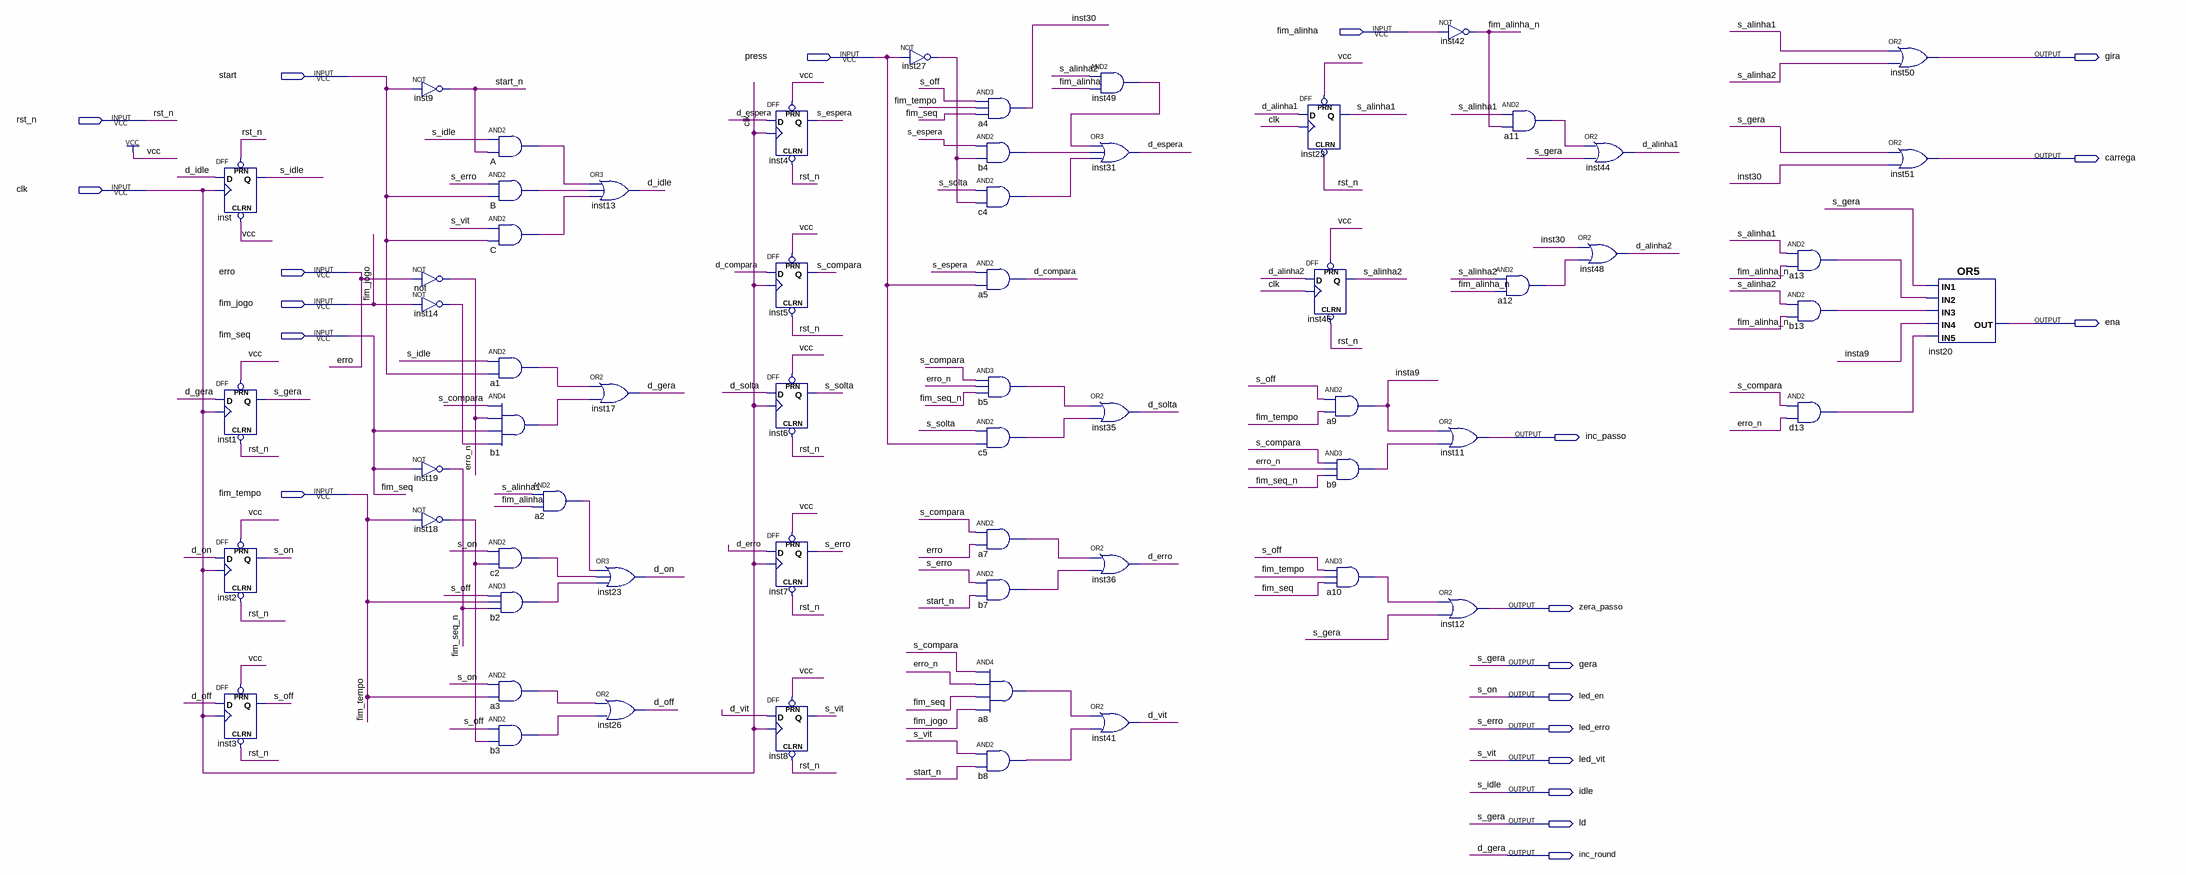
[diagram p0: schematic sheet]
// Quartus schematic fsm.bdf as structural Verilog: 62 symbols, 21 pins
module fsm (
  input  fim_alinha,
  input  press,
  input  start,
  input  rst_n,
  input  clk,
  input  erro,
  input  fim_jogo,
  input  fim_seq,
  input  fim_tempo,
  output gira,
  output carrega,
  output ena,
  output inc_passo,
  output zera_passo,
  output gera,
  output led_en,
  output led_erro,
  output led_vit,
  output idle,
  output ld,
  output inc_round
);

  wire a1_out, a2_out, a3_out, a7_out, a8_out, a10_out, a11_out, a12_out, a13_out, A_out, b1_out, b2_out,
       b3_out, b4_out, b5_out, b7_out, b8_out, b9_out, b13_out, B_out, c2_out, c4_out, c5_out, C_out,
       d13_out, d_alinha1, d_alinha2, d_compara, d_erro, d_espera, d_idle, d_off, d_on, d_solta, d_vit,
       erro_n, fim_alinha_n, fim_seq_n, inst14_out, inst18_out, inst27_out, inst30, inst49_out, insta9,
       s_alinha1, s_alinha2, s_compara, s_espera, s_off, s_solta, start_n;

  DFF inst (.CLRN(1'b1), .CLK(clk), .D(d_idle), .PRN(rst_n), .Q(idle));
  DFF inst1 (.CLRN(rst_n), .CLK(clk), .D(inc_round), .PRN(1'b1), .Q(gera));
  DFF inst2 (.CLRN(rst_n), .CLK(clk), .D(d_on), .PRN(1'b1), .Q(led_en));
  DFF inst3 (.CLRN(rst_n), .CLK(clk), .D(d_off), .PRN(1'b1), .Q(s_off));
  not inst9 (start_n, start);
  not \not  (erro_n, erro);
  not inst14 (inst14_out, fim_jogo);
  not inst19 (fim_seq_n, fim_seq);
  not inst18 (inst18_out, fim_tempo);
  and A (A_out, idle, start_n);
  and B (B_out, led_erro, start);
  and C (C_out, led_vit, start);
  and a1 (a1_out, idle, start);
  and b1 (b1_out, s_compara, erro_n, fim_seq, inst14_out);
  and c2 (c2_out, led_en, inst18_out);
  and b2 (b2_out, s_off, fim_tempo, fim_seq_n);
  and a3 (a3_out, led_en, fim_tempo);
  and b3 (b3_out, s_off, inst18_out);
  and a2 (a2_out, s_alinha1, fim_alinha);
  or inst13 (d_idle, A_out, B_out, C_out);
  or inst17 (inc_round, a1_out, b1_out);
  or inst23 (d_on, a2_out, c2_out, b2_out);
  or inst26 (d_off, a3_out, b3_out);
  DFF inst4 (.CLRN(rst_n), .CLK(clk), .D(d_espera), .PRN(1'b1), .Q(s_espera));
  DFF inst5 (.CLRN(rst_n), .CLK(clk), .D(d_compara), .PRN(1'b1), .Q(s_compara));
  DFF inst6 (.CLRN(rst_n), .CLK(clk), .D(d_solta), .PRN(1'b1), .Q(s_solta));
  DFF inst7 (.CLRN(rst_n), .CLK(clk), .D(d_erro), .PRN(1'b1), .Q(led_erro));
  DFF inst8 (.CLRN(rst_n), .CLK(clk), .D(d_vit), .PRN(1'b1), .Q(led_vit));
  not inst27 (inst27_out, press);
  and a4 (inst30, s_off, fim_tempo, fim_seq);
  and b4 (b4_out, s_espera, inst27_out);
  and c4 (c4_out, s_solta, inst27_out);
  and a5 (d_compara, s_espera, press);
  and b5 (b5_out, s_compara, erro_n, fim_seq_n);
  and c5 (c5_out, s_solta, press);
  and a7 (a7_out, s_compara, erro);
  and b7 (b7_out, led_erro, start_n);
  and a8 (a8_out, s_compara, erro_n, fim_seq, fim_jogo);
  and b8 (b8_out, led_vit, start_n);
  and inst49 (inst49_out, s_alinha2, fim_alinha);
  or inst31 (d_espera, inst49_out, b4_out, c4_out);
  or inst35 (d_solta, b5_out, c5_out);
  or inst36 (d_erro, a7_out, b7_out);
  or inst41 (d_vit, a8_out, b8_out);
  DFF inst22 (.CLRN(rst_n), .CLK(clk), .D(d_alinha1), .PRN(1'b1), .Q(s_alinha1));
  DFF inst46 (.CLRN(rst_n), .CLK(clk), .D(d_alinha2), .PRN(1'b1), .Q(s_alinha2));
  and a9 (insta9, s_off, fim_tempo);
  and b9 (b9_out, s_compara, erro_n, fim_seq_n);
  and a10 (a10_out, s_off, fim_tempo, fim_seq);
  not inst42 (fim_alinha_n, fim_alinha);
  or inst11 (inc_passo, insta9, b9_out);
  or inst12 (zera_passo, a10_out, gera);
  and a11 (a11_out, s_alinha1, fim_alinha_n);
  and a12 (a12_out, s_alinha2, fim_alinha_n);
  or inst48 (d_alinha2, inst30, a12_out);
  or inst44 (d_alinha1, a11_out, gera);
  and a13 (a13_out, s_alinha1, fim_alinha_n);
  and b13 (b13_out, s_alinha2, fim_alinha_n);
  and d13 (d13_out, s_compara, erro_n);
  or inst50 (gira, s_alinha1, s_alinha2);
  or inst51 (carrega, gera, inst30);
  or inst20 (ena, gera, a13_out, b13_out, insta9, d13_out);

  assign ld = gera;

  // Other names for the same wires on the sheet: d_gera = inc_round; s_erro = led_erro; s_gera = gera; s_idle = idle;
  //   s_on = led_en; s_vit = led_vit
endmodule
